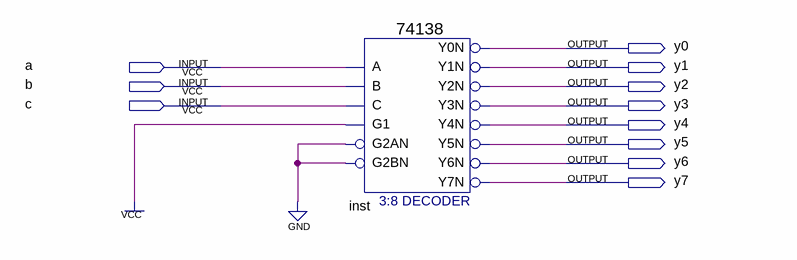
[diagram p0: schematic sheet]
// Quartus schematic 74138_.bdf as structural Verilog: 1 symbols, 11 pins
module \74138_  (
  input  a,
  input  b,
  input  c,
  output y0,
  output y1,
  output y2,
  output y3,
  output y4,
  output y5,
  output y6,
  output y7
);

  \74138  inst (
    .A(a), .B(b), .G1(1'b1), .C(c), .G2AN(1'b0), .G2BN(1'b0), .Y0N(y0), .Y1N(y1), .Y2N(y2), .Y3N(y3),
    .Y4N(y4), .Y5N(y5), .Y6N(y6), .Y7N(y7));
endmodule
